# Altium schematic sheet DSP大板子.SchDoc (part 3 of 7)
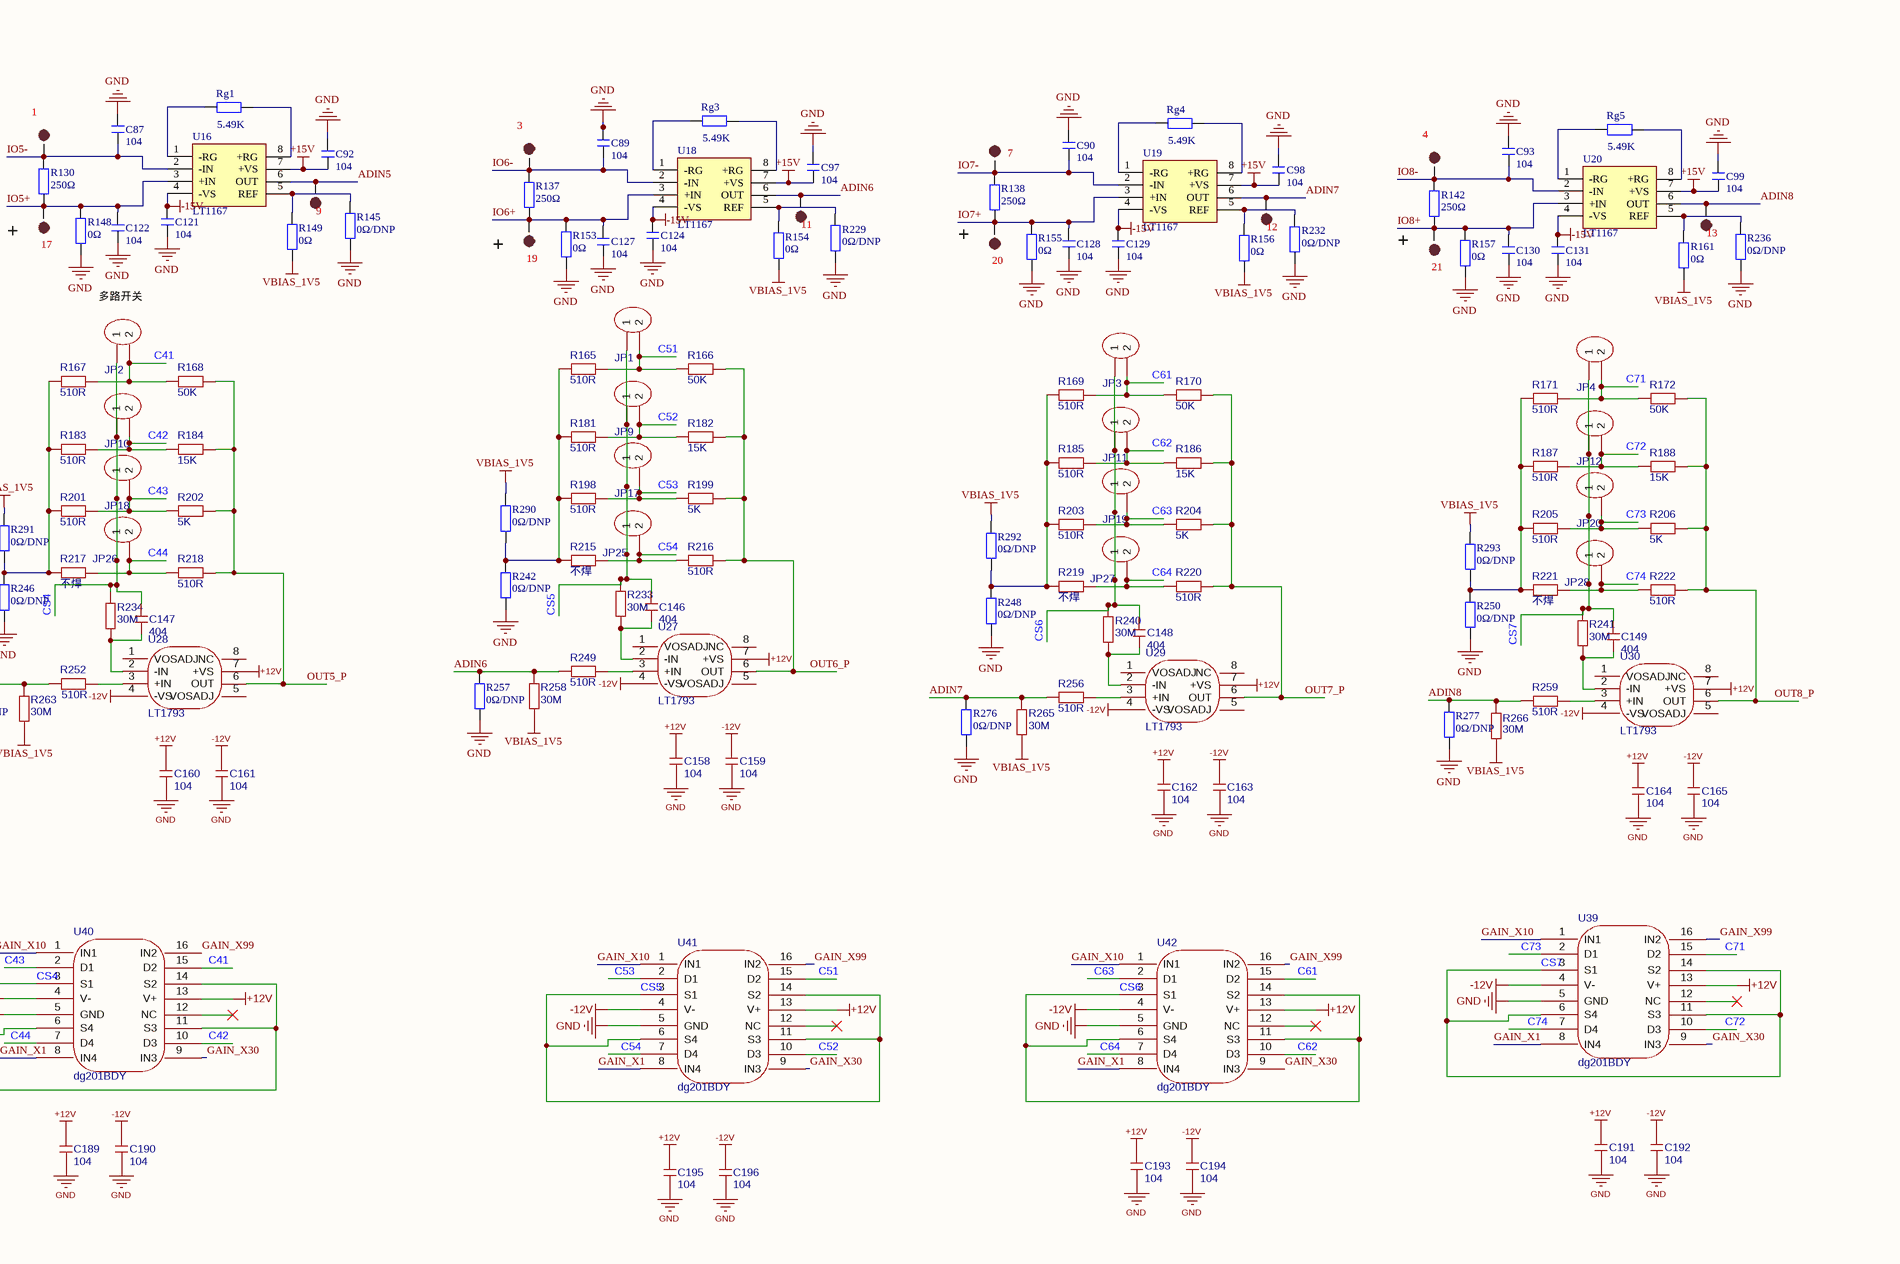
[diagram p106: DSP大板子.SchDoc, bottom right]

# Altium schematic sheet DSP大板子.SchDoc (continued)
D7 = bzt52c12-7-f: 二极管配置:1个独立式;稳压值(标称值):12V;稳压值(范围值):11.4V~12.7V;耗散功率(Pd):370mW;; Manufacturer: DIODES(美台); AddInBom: yes; ModelId: ad7e39f9e5534b3c96ffdc5532ebb493; ModelName: SOD-123_L2.7-W1.6-H1.4-LS3.7; ModelTransform: 146.026,62.992,0,180,0,0,0.0005,0,0; Diode Configuration: 1个独立式; Zener Voltage(Nom): 12V; Reverse Leakage Current (Ir): 100nA@1V; Pd - Power Dissipation: 370mW; Impedance(Zzt): 25Ω; Impedance(Zzk): 150Ω; Operating Junction Temperature Range: -65℃~+150℃; Symbol: BZT52C12-7-F; LCSC Part Name: 独立式 耐压:12V 电流:0.1uA@1.0V; SupplierPart: C124196; ManufacturerPart: BZT52C12-7-F; Supplier Footprint: SOD-123; JLCPCB Part Class: Extended Part; Datasheet: https://item.szlcsc.com/datasheet/BZT52C12-7-F/125471.html; Supplier: LCSC; ConvertToPcb: yes; FootprintName: SOD-123_L2.7-W1.6-LS3.7-RD; Zener Voltage(Range): 11.4V~12.7V; Tolerance: -
F1 = 0451003.mrl: 类型:贴片式保险丝;额定电流:3A;额定电压:125V;分断能力:50A;; Manufacturer: Littelfuse(美国力特); AddInBom: yes; ModelId: ab98867368e34e88a7540bafa62641fb; ModelName: FUSE-SMD_L6.1-W2.7-H2.7; ModelTransform: 240.157,106.299,0,0,0,0,-0.0005,0.0005,0; Type: 贴片式保险丝; Current Rating: 3A; Voltage Rating (DC): 125V; Melting I2t: 0.459; Interrupt Rating: 50A; Symbol: 0451003.MRL; LCSC Part Name: 125V贴片式保险丝; SupplierPart: C13982; ManufacturerPart: 0451003.MRL; Supplier Footprint: 2410; JLCPCB Part Class: Extended Part; Datasheet: https://item.szlcsc.com/datasheet/0451003.MRL/14638.html; Supplier: LCSC; ConvertToPcb: yes; FootprintName: FUSE-SMD_L6.1-W2.7; Operating Temperature: -55℃~+125℃; Diameter (φD): -; Length: 6.1mm; Width: 2.5mm; Height: -; Pitch: -
H1 = a254up-zs05p: 插针结构:2x5P;间距:2.54mm;行距:2.54mm;圆针/方针:方针;安装方式:直插;排数:双排;总PIN位数:10P;额定电流:3A;配合针长度:6mm;塑高:2.5mm;触头材质:铜合金;触头镀层:金;工作温度:-40℃~+105℃;颜色:黑色;; Manufacturer: BXCONN(宝讯); AddInBom: yes; ModelId: c4cfba895466416fb2f10be924625d31; ModelTransform: 500.00294,196.85,0,0,0,0,0,0,-118.11; Pin Structure: 2x5P; Pitch: 2.54mm; Circluar Pins/Square Pins: 方针; Current Rating: 3A; Symbol: A254UP-ZS05P; LCSC Part Name: 2x5P 间距:2.54mm 方针 直插; SupplierPart: C41413842; ManufacturerPart: A254UP-ZS05P; Supplier Footprint: 插件,P=2.54mm; JLCPCB Part Class: Extended Part; Datasheet: https://item.szlcsc.com/datasheet/A254UP-ZS05P/43230049.html; Supplier: LCSC; ConvertToPcb: yes; FootprintName: HDR-TH_10P-P2.54-V-M-R2-C5-S2.54; ModelName: HDR-TH_10P-P2.54-V-M-R2-C5-S2.54; Row Spacing: 2.54mm; Mounting Type: 直插; Number of Rows: 双排; Number of Pins: 10P; Length of Mating Pin: 6mm; Insulation Height: 2.5mm; Contact Material: 铜合金; Contact Plating: 金; Operating Temperature: -40℃~+105℃; Color: 黑色
J2 = Header 12X2: 12*2P接插件; 版权归属: 封装库来自淘宝卖家 ID：黄晶宝石; BOM名称: 12*2P接插件; 学习资源: https://shop463601444.taobao.com
JP1 = Header 2: 2P接插件; 版权归属: 封装库来自淘宝 ID：黄晶宝石; Origin Footprint: XH2.54-WI-2P; OriginFootprint 2: XH2.54-LI-2P; OriginFootprint 3: HDR2.54-M-LI-2P; OriginFootprint 4: HDR2.54-WI-2P; OriginFootprint 5: HDR2.54-WS-2P; OriginFootprint 7: HDR2.54-M-WS-2P; OriginFootprint 8: KF2510-LI-2P; OriginFootprint 9: XH2.54-WS-2P; OriginFootprint 10: XH2.54-LS-2P; OriginFootprint 11: KF2EDGK-2.54-LI-2P; OriginFootprint 12: KF2EDGK-2.54-WI-2P; UniqueId: 307b99641c701ee0; AddInBom: yes; OriginModelName: HDR2.54-1P; Device: Header 2; BOM名称: 2P接插件; 联系售后: https://shop463601444.taobao.com; OriginFootprint 6: HDR2.54-Y-LI-2P; DesignItemID: Header 2; LibraryName: 5.4 - 接插件-脚距2.54 (100mil); SymbolName: Header 2; FootprintName: HDR2.54-LI-2P
JP2 = Header 2: 2P接插件; 版权归属: 封装库来自淘宝 ID：黄晶宝石; Origin Footprint: XH2.54-WI-2P; OriginFootprint 2: XH2.54-LI-2P; OriginFootprint 3: HDR2.54-M-LI-2P; OriginFootprint 4: HDR2.54-WI-2P; OriginFootprint 5: HDR2.54-WS-2P; OriginFootprint 7: HDR2.54-M-WS-2P; OriginFootprint 8: KF2510-LI-2P; OriginFootprint 9: XH2.54-WS-2P; OriginFootprint 10: XH2.54-LS-2P; OriginFootprint 11: KF2EDGK-2.54-LI-2P; OriginFootprint 12: KF2EDGK-2.54-WI-2P; UniqueId: 62dfc6d8d4781687; AddInBom: yes; OriginModelName: HDR2.54-1P; Device: Header 2; BOM名称: 2P接插件; 联系售后: https://shop463601444.taobao.com; OriginFootprint 6: HDR2.54-Y-LI-2P; DesignItemID: Header 2; LibraryName: 5.4 - 接插件-脚距2.54 (100mil); SymbolName: Header 2; FootprintName: HDR2.54-LI-2P
JP3 = Header 2: 2P接插件; 版权归属: 封装库来自淘宝 ID：黄晶宝石; Origin Footprint: XH2.54-WI-2P; OriginFootprint 2: XH2.54-LI-2P; OriginFootprint 3: HDR2.54-M-LI-2P; OriginFootprint 4: HDR2.54-WI-2P; OriginFootprint 5: HDR2.54-WS-2P; OriginFootprint 7: HDR2.54-M-WS-2P; OriginFootprint 8: KF2510-LI-2P; OriginFootprint 9: XH2.54-WS-2P; OriginFootprint 10: XH2.54-LS-2P; OriginFootprint 11: KF2EDGK-2.54-LI-2P; OriginFootprint 12: KF2EDGK-2.54-WI-2P; UniqueId: 7db8ea879d3067b5; AddInBom: yes; OriginModelName: HDR2.54-1P; Device: Header 2; BOM名称: 2P接插件; 联系售后: https://shop463601444.taobao.com; OriginFootprint 6: HDR2.54-Y-LI-2P; DesignItemID: Header 2; LibraryName: 5.4 - 接插件-脚距2.54 (100mil); SymbolName: Header 2; FootprintName: HDR2.54-LI-2P
JP4 = Header 2: 2P接插件; 版权归属: 封装库来自淘宝 ID：黄晶宝石; Origin Footprint: XH2.54-WI-2P; OriginFootprint 2: XH2.54-LI-2P; OriginFootprint 3: HDR2.54-M-LI-2P; OriginFootprint 4: HDR2.54-WI-2P; OriginFootprint 5: HDR2.54-WS-2P; OriginFootprint 7: HDR2.54-M-WS-2P; OriginFootprint 8: KF2510-LI-2P; OriginFootprint 9: XH2.54-WS-2P; OriginFootprint 10: XH2.54-LS-2P; OriginFootprint 11: KF2EDGK-2.54-LI-2P; OriginFootprint 12: KF2EDGK-2.54-WI-2P; UniqueId: fa82831371ccd6d5; AddInBom: yes; OriginModelName: HDR2.54-1P; Device: Header 2; BOM名称: 2P接插件; 联系售后: https://shop463601444.taobao.com; OriginFootprint 6: HDR2.54-Y-LI-2P; DesignItemID: Header 2; LibraryName: 5.4 - 接插件-脚距2.54 (100mil); SymbolName: Header 2; FootprintName: HDR2.54-LI-2P
JP5 = Header 2: 2P接插件; 版权归属: 封装库来自淘宝 ID：黄晶宝石; Origin Footprint: XH2.54-WI-2P; OriginFootprint 2: XH2.54-LI-2P; OriginFootprint 3: HDR2.54-M-LI-2P; OriginFootprint 4: HDR2.54-WI-2P; OriginFootprint 5: HDR2.54-WS-2P; OriginFootprint 7: HDR2.54-M-WS-2P; OriginFootprint 8: KF2510-LI-2P; OriginFootprint 9: XH2.54-WS-2P; OriginFootprint 10: XH2.54-LS-2P; OriginFootprint 11: KF2EDGK-2.54-LI-2P; OriginFootprint 12: KF2EDGK-2.54-WI-2P; UniqueId: 6910556eac3a76a2; AddInBom: yes; OriginModelName: HDR2.54-1P; Device: Header 2; BOM名称: 2P接插件; 联系售后: https://shop463601444.taobao.com; OriginFootprint 6: HDR2.54-Y-LI-2P; DesignItemID: Header 2; LibraryName: 5.4 - 接插件-脚距2.54 (100mil); SymbolName: Header 2; FootprintName: HDR2.54-LI-2P
JP6 = Header 2: 2P接插件; 版权归属: 封装库来自淘宝 ID：黄晶宝石; Origin Footprint: XH2.54-WI-2P; OriginFootprint 2: XH2.54-LI-2P; OriginFootprint 3: HDR2.54-M-LI-2P; OriginFootprint 4: HDR2.54-WI-2P; OriginFootprint 5: HDR2.54-WS-2P; OriginFootprint 7: HDR2.54-M-WS-2P; OriginFootprint 8: KF2510-LI-2P; OriginFootprint 9: XH2.54-WS-2P; OriginFootprint 10: XH2.54-LS-2P; OriginFootprint 11: KF2EDGK-2.54-LI-2P; OriginFootprint 12: KF2EDGK-2.54-WI-2P; UniqueId: 1e4a53fbbd604e66; AddInBom: yes; OriginModelName: HDR2.54-1P; Device: Header 2; BOM名称: 2P接插件; 联系售后: https://shop463601444.taobao.com; OriginFootprint 6: HDR2.54-Y-LI-2P; DesignItemID: Header 2; LibraryName: 5.4 - 接插件-脚距2.54 (100mil); SymbolName: Header 2; FootprintName: HDR2.54-LI-2P
JP7 = Header 2: 2P接插件; 版权归属: 封装库来自淘宝 ID：黄晶宝石; Origin Footprint: XH2.54-WI-2P; OriginFootprint 2: XH2.54-LI-2P; OriginFootprint 3: HDR2.54-M-LI-2P; OriginFootprint 4: HDR2.54-WI-2P; OriginFootprint 5: HDR2.54-WS-2P; OriginFootprint 7: HDR2.54-M-WS-2P; OriginFootprint 8: KF2510-LI-2P; OriginFootprint 9: XH2.54-WS-2P; OriginFootprint 10: XH2.54-LS-2P; OriginFootprint 11: KF2EDGK-2.54-LI-2P; OriginFootprint 12: KF2EDGK-2.54-WI-2P; UniqueId: 6655918135225170; AddInBom: yes; OriginModelName: HDR2.54-1P; Device: Header 2; BOM名称: 2P接插件; 联系售后: https://shop463601444.taobao.com; OriginFootprint 6: HDR2.54-Y-LI-2P; DesignItemID: Header 2; LibraryName: 5.4 - 接插件-脚距2.54 (100mil); SymbolName: Header 2; FootprintName: HDR2.54-LI-2P
JP8 = Header 2: 2P接插件; 版权归属: 封装库来自淘宝 ID：黄晶宝石; Origin Footprint: XH2.54-WI-2P; OriginFootprint 2: XH2.54-LI-2P; OriginFootprint 3: HDR2.54-M-LI-2P; OriginFootprint 4: HDR2.54-WI-2P; OriginFootprint 5: HDR2.54-WS-2P; OriginFootprint 7: HDR2.54-M-WS-2P; OriginFootprint 8: KF2510-LI-2P; OriginFootprint 9: XH2.54-WS-2P; OriginFootprint 10: XH2.54-LS-2P; OriginFootprint 11: KF2EDGK-2.54-LI-2P; OriginFootprint 12: KF2EDGK-2.54-WI-2P; UniqueId: 4577e3d3da87c365; AddInBom: yes; OriginModelName: HDR2.54-1P; Device: Header 2; BOM名称: 2P接插件; 联系售后: https://shop463601444.taobao.com; OriginFootprint 6: HDR2.54-Y-LI-2P; DesignItemID: Header 2; LibraryName: 5.4 - 接插件-脚距2.54 (100mil); SymbolName: Header 2; FootprintName: HDR2.54-LI-2P
JP9 = Header 2: 2P接插件; 版权归属: 封装库来自淘宝 ID：黄晶宝石; Origin Footprint: XH2.54-WI-2P; OriginFootprint 2: XH2.54-LI-2P; OriginFootprint 3: HDR2.54-M-LI-2P; OriginFootprint 4: HDR2.54-WI-2P; OriginFootprint 5: HDR2.54-WS-2P; OriginFootprint 7: HDR2.54-M-WS-2P; OriginFootprint 8: KF2510-LI-2P; OriginFootprint 9: XH2.54-WS-2P; OriginFootprint 10: XH2.54-LS-2P; OriginFootprint 11: KF2EDGK-2.54-LI-2P; OriginFootprint 12: KF2EDGK-2.54-WI-2P; UniqueId: 85e96206a86bca40; AddInBom: yes; OriginModelName: HDR2.54-1P; Device: Header 2; BOM名称: 2P接插件; 联系售后: https://shop463601444.taobao.com; OriginFootprint 6: HDR2.54-Y-LI-2P; DesignItemID: Header 2; LibraryName: 5.4 - 接插件-脚距2.54 (100mil); SymbolName: Header 2; FootprintName: HDR2.54-LI-2P
JP10 = Header 2: 2P接插件; 版权归属: 封装库来自淘宝 ID：黄晶宝石; Origin Footprint: XH2.54-WI-2P; OriginFootprint 2: XH2.54-LI-2P; OriginFootprint 3: HDR2.54-M-LI-2P; OriginFootprint 4: HDR2.54-WI-2P; OriginFootprint 5: HDR2.54-WS-2P; OriginFootprint 7: HDR2.54-M-WS-2P; OriginFootprint 8: KF2510-LI-2P; OriginFootprint 9: XH2.54-WS-2P; OriginFootprint 10: XH2.54-LS-2P; OriginFootprint 11: KF2EDGK-2.54-LI-2P; OriginFootprint 12: KF2EDGK-2.54-WI-2P; UniqueId: ddeec7be49001c93; AddInBom: yes; OriginModelName: HDR2.54-1P; Device: Header 2; BOM名称: 2P接插件; 联系售后: https://shop463601444.taobao.com; OriginFootprint 6: HDR2.54-Y-LI-2P; DesignItemID: Header 2; LibraryName: 5.4 - 接插件-脚距2.54 (100mil); SymbolName: Header 2; FootprintName: HDR2.54-LI-2P
JP11 = Header 2: 2P接插件; 版权归属: 封装库来自淘宝 ID：黄晶宝石; Origin Footprint: XH2.54-WI-2P; OriginFootprint 2: XH2.54-LI-2P; OriginFootprint 3: HDR2.54-M-LI-2P; OriginFootprint 4: HDR2.54-WI-2P; OriginFootprint 5: HDR2.54-WS-2P; OriginFootprint 7: HDR2.54-M-WS-2P; OriginFootprint 8: KF2510-LI-2P; OriginFootprint 9: XH2.54-WS-2P; OriginFootprint 10: XH2.54-LS-2P; OriginFootprint 11: KF2EDGK-2.54-LI-2P; OriginFootprint 12: KF2EDGK-2.54-WI-2P; UniqueId: 6d8656e8ed237838; AddInBom: yes; OriginModelName: HDR2.54-1P; Device: Header 2; BOM名称: 2P接插件; 联系售后: https://shop463601444.taobao.com; OriginFootprint 6: HDR2.54-Y-LI-2P; DesignItemID: Header 2; LibraryName: 5.4 - 接插件-脚距2.54 (100mil); SymbolName: Header 2; FootprintName: HDR2.54-LI-2P
JP12 = Header 2: 2P接插件; 版权归属: 封装库来自淘宝 ID：黄晶宝石; Origin Footprint: XH2.54-WI-2P; OriginFootprint 2: XH2.54-LI-2P; OriginFootprint 3: HDR2.54-M-LI-2P; OriginFootprint 4: HDR2.54-WI-2P; OriginFootprint 5: HDR2.54-WS-2P; OriginFootprint 7: HDR2.54-M-WS-2P; OriginFootprint 8: KF2510-LI-2P; OriginFootprint 9: XH2.54-WS-2P; OriginFootprint 10: XH2.54-LS-2P; OriginFootprint 11: KF2EDGK-2.54-LI-2P; OriginFootprint 12: KF2EDGK-2.54-WI-2P; UniqueId: fcba59359dd8e679; AddInBom: yes; OriginModelName: HDR2.54-1P; Device: Header 2; BOM名称: 2P接插件; 联系售后: https://shop463601444.taobao.com; OriginFootprint 6: HDR2.54-Y-LI-2P; DesignItemID: Header 2; LibraryName: 5.4 - 接插件-脚距2.54 (100mil); SymbolName: Header 2; FootprintName: HDR2.54-LI-2P
JP13 = Header 2: 2P接插件; 版权归属: 封装库来自淘宝 ID：黄晶宝石; Origin Footprint: XH2.54-WI-2P; OriginFootprint 2: XH2.54-LI-2P; OriginFootprint 3: HDR2.54-M-LI-2P; OriginFootprint 4: HDR2.54-WI-2P; OriginFootprint 5: HDR2.54-WS-2P; OriginFootprint 7: HDR2.54-M-WS-2P; OriginFootprint 8: KF2510-LI-2P; OriginFootprint 9: XH2.54-WS-2P; OriginFootprint 10: XH2.54-LS-2P; OriginFootprint 11: KF2EDGK-2.54-LI-2P; OriginFootprint 12: KF2EDGK-2.54-WI-2P; UniqueId: 2c2198ed19c983b6; AddInBom: yes; OriginModelName: HDR2.54-1P; Device: Header 2; BOM名称: 2P接插件; 联系售后: https://shop463601444.taobao.com; OriginFootprint 6: HDR2.54-Y-LI-2P; DesignItemID: Header 2; LibraryName: 5.4 - 接插件-脚距2.54 (100mil); SymbolName: Header 2; FootprintName: HDR2.54-LI-2P
JP14 = Header 2: 2P接插件; 版权归属: 封装库来自淘宝 ID：黄晶宝石; Origin Footprint: XH2.54-WI-2P; OriginFootprint 2: XH2.54-LI-2P; OriginFootprint 3: HDR2.54-M-LI-2P; OriginFootprint 4: HDR2.54-WI-2P; OriginFootprint 5: HDR2.54-WS-2P; OriginFootprint 7: HDR2.54-M-WS-2P; OriginFootprint 8: KF2510-LI-2P; OriginFootprint 9: XH2.54-WS-2P; OriginFootprint 10: XH2.54-LS-2P; OriginFootprint 11: KF2EDGK-2.54-LI-2P; OriginFootprint 12: KF2EDGK-2.54-WI-2P; UniqueId: 2a3f0cfc6900396e; AddInBom: yes; OriginModelName: HDR2.54-1P; Device: Header 2; BOM名称: 2P接插件; 联系售后: https://shop463601444.taobao.com; OriginFootprint 6: HDR2.54-Y-LI-2P; DesignItemID: Header 2; LibraryName: 5.4 - 接插件-脚距2.54 (100mil); SymbolName: Header 2; FootprintName: HDR2.54-LI-2P
JP15 = Header 2: 2P接插件; 版权归属: 封装库来自淘宝 ID：黄晶宝石; Origin Footprint: XH2.54-WI-2P; OriginFootprint 2: XH2.54-LI-2P; OriginFootprint 3: HDR2.54-M-LI-2P; OriginFootprint 4: HDR2.54-WI-2P; OriginFootprint 5: HDR2.54-WS-2P; OriginFootprint 7: HDR2.54-M-WS-2P; OriginFootprint 8: KF2510-LI-2P; OriginFootprint 9: XH2.54-WS-2P; OriginFootprint 10: XH2.54-LS-2P; OriginFootprint 11: KF2EDGK-2.54-LI-2P; OriginFootprint 12: KF2EDGK-2.54-WI-2P; UniqueId: 57b57ccbe062354d; AddInBom: yes; OriginModelName: HDR2.54-1P; Device: Header 2; BOM名称: 2P接插件; 联系售后: https://shop463601444.taobao.com; OriginFootprint 6: HDR2.54-Y-LI-2P; DesignItemID: Header 2; LibraryName: 5.4 - 接插件-脚距2.54 (100mil); SymbolName: Header 2; FootprintName: HDR2.54-LI-2P
JP16 = Header 2: 2P接插件; 版权归属: 封装库来自淘宝 ID：黄晶宝石; Origin Footprint: XH2.54-WI-2P; OriginFootprint 2: XH2.54-LI-2P; OriginFootprint 3: HDR2.54-M-LI-2P; OriginFootprint 4: HDR2.54-WI-2P; OriginFootprint 5: HDR2.54-WS-2P; OriginFootprint 7: HDR2.54-M-WS-2P; OriginFootprint 8: KF2510-LI-2P; OriginFootprint 9: XH2.54-WS-2P; OriginFootprint 10: XH2.54-LS-2P; OriginFootprint 11: KF2EDGK-2.54-LI-2P; OriginFootprint 12: KF2EDGK-2.54-WI-2P; UniqueId: d84cd54a2cd93ea0; AddInBom: yes; OriginModelName: HDR2.54-1P; Device: Header 2; BOM名称: 2P接插件; 联系售后: https://shop463601444.taobao.com; OriginFootprint 6: HDR2.54-Y-LI-2P; DesignItemID: Header 2; LibraryName: 5.4 - 接插件-脚距2.54 (100mil); SymbolName: Header 2; FootprintName: HDR2.54-LI-2P
JP17 = Header 2: 2P接插件; 版权归属: 封装库来自淘宝 ID：黄晶宝石; Origin Footprint: XH2.54-WI-2P; OriginFootprint 2: XH2.54-LI-2P; OriginFootprint 3: HDR2.54-M-LI-2P; OriginFootprint 4: HDR2.54-WI-2P; OriginFootprint 5: HDR2.54-WS-2P; OriginFootprint 7: HDR2.54-M-WS-2P; OriginFootprint 8: KF2510-LI-2P; OriginFootprint 9: XH2.54-WS-2P; OriginFootprint 10: XH2.54-LS-2P; OriginFootprint 11: KF2EDGK-2.54-LI-2P; OriginFootprint 12: KF2EDGK-2.54-WI-2P; UniqueId: c40e93d5b111b9de; AddInBom: yes; OriginModelName: HDR2.54-1P; Device: Header 2; BOM名称: 2P接插件; 联系售后: https://shop463601444.taobao.com; OriginFootprint 6: HDR2.54-Y-LI-2P; DesignItemID: Header 2; LibraryName: 5.4 - 接插件-脚距2.54 (100mil); SymbolName: Header 2; FootprintName: HDR2.54-LI-2P
JP18 = Header 2: 2P接插件; 版权归属: 封装库来自淘宝 ID：黄晶宝石; Origin Footprint: XH2.54-WI-2P; OriginFootprint 2: XH2.54-LI-2P; OriginFootprint 3: HDR2.54-M-LI-2P; OriginFootprint 4: HDR2.54-WI-2P; OriginFootprint 5: HDR2.54-WS-2P; OriginFootprint 7: HDR2.54-M-WS-2P; OriginFootprint 8: KF2510-LI-2P; OriginFootprint 9: XH2.54-WS-2P; OriginFootprint 10: XH2.54-LS-2P; OriginFootprint 11: KF2EDGK-2.54-LI-2P; OriginFootprint 12: KF2EDGK-2.54-WI-2P; UniqueId: dacbd2010d520776; AddInBom: yes; OriginModelName: HDR2.54-1P; Device: Header 2; BOM名称: 2P接插件; 联系售后: https://shop463601444.taobao.com; OriginFootprint 6: HDR2.54-Y-LI-2P; DesignItemID: Header 2; LibraryName: 5.4 - 接插件-脚距2.54 (100mil); SymbolName: Header 2; FootprintName: HDR2.54-LI-2P
JP19 = Header 2: 2P接插件; 版权归属: 封装库来自淘宝 ID：黄晶宝石; Origin Footprint: XH2.54-WI-2P; OriginFootprint 2: XH2.54-LI-2P; OriginFootprint 3: HDR2.54-M-LI-2P; OriginFootprint 4: HDR2.54-WI-2P; OriginFootprint 5: HDR2.54-WS-2P; OriginFootprint 7: HDR2.54-M-WS-2P; OriginFootprint 8: KF2510-LI-2P; OriginFootprint 9: XH2.54-WS-2P; OriginFootprint 10: XH2.54-LS-2P; OriginFootprint 11: KF2EDGK-2.54-LI-2P; OriginFootprint 12: KF2EDGK-2.54-WI-2P; UniqueId: 61cd62acef56a4b1; AddInBom: yes; OriginModelName: HDR2.54-1P; Device: Header 2; BOM名称: 2P接插件; 联系售后: https://shop463601444.taobao.com; OriginFootprint 6: HDR2.54-Y-LI-2P; DesignItemID: Header 2; LibraryName: 5.4 - 接插件-脚距2.54 (100mil); SymbolName: Header 2; FootprintName: HDR2.54-LI-2P
JP20 = Header 2: 2P接插件; 版权归属: 封装库来自淘宝 ID：黄晶宝石; Origin Footprint: XH2.54-WI-2P; OriginFootprint 2: XH2.54-LI-2P; OriginFootprint 3: HDR2.54-M-LI-2P; OriginFootprint 4: HDR2.54-WI-2P; OriginFootprint 5: HDR2.54-WS-2P; OriginFootprint 7: HDR2.54-M-WS-2P; OriginFootprint 8: KF2510-LI-2P; OriginFootprint 9: XH2.54-WS-2P; OriginFootprint 10: XH2.54-LS-2P; OriginFootprint 11: KF2EDGK-2.54-LI-2P; OriginFootprint 12: KF2EDGK-2.54-WI-2P; UniqueId: 228f0eb2e9fc8410; AddInBom: yes; OriginModelName: HDR2.54-1P; Device: Header 2; BOM名称: 2P接插件; 联系售后: https://shop463601444.taobao.com; OriginFootprint 6: HDR2.54-Y-LI-2P; DesignItemID: Header 2; LibraryName: 5.4 - 接插件-脚距2.54 (100mil); SymbolName: Header 2; FootprintName: HDR2.54-LI-2P
JP21 = Header 2: 2P接插件; 版权归属: 封装库来自淘宝 ID：黄晶宝石; Origin Footprint: XH2.54-WI-2P; OriginFootprint 2: XH2.54-LI-2P; OriginFootprint 3: HDR2.54-M-LI-2P; OriginFootprint 4: HDR2.54-WI-2P; OriginFootprint 5: HDR2.54-WS-2P; OriginFootprint 7: HDR2.54-M-WS-2P; OriginFootprint 8: KF2510-LI-2P; OriginFootprint 9: XH2.54-WS-2P; OriginFootprint 10: XH2.54-LS-2P; OriginFootprint 11: KF2EDGK-2.54-LI-2P; OriginFootprint 12: KF2EDGK-2.54-WI-2P; UniqueId: 8401f236ce86758e; AddInBom: yes; OriginModelName: HDR2.54-1P; Device: Header 2; BOM名称: 2P接插件; 联系售后: https://shop463601444.taobao.com; OriginFootprint 6: HDR2.54-Y-LI-2P; DesignItemID: Header 2; LibraryName: 5.4 - 接插件-脚距2.54 (100mil); SymbolName: Header 2; FootprintName: HDR2.54-LI-2P
JP22 = Header 2: 2P接插件; 版权归属: 封装库来自淘宝 ID：黄晶宝石; Origin Footprint: XH2.54-WI-2P; OriginFootprint 2: XH2.54-LI-2P; OriginFootprint 3: HDR2.54-M-LI-2P; OriginFootprint 4: HDR2.54-WI-2P; OriginFootprint 5: HDR2.54-WS-2P; OriginFootprint 7: HDR2.54-M-WS-2P; OriginFootprint 8: KF2510-LI-2P; OriginFootprint 9: XH2.54-WS-2P; OriginFootprint 10: XH2.54-LS-2P; OriginFootprint 11: KF2EDGK-2.54-LI-2P; OriginFootprint 12: KF2EDGK-2.54-WI-2P; UniqueId: 81515d3ba89c45d7; AddInBom: yes; OriginModelName: HDR2.54-1P; Device: Header 2; BOM名称: 2P接插件; 联系售后: https://shop463601444.taobao.com; OriginFootprint 6: HDR2.54-Y-LI-2P; DesignItemID: Header 2; LibraryName: 5.4 - 接插件-脚距2.54 (100mil); SymbolName: Header 2; FootprintName: HDR2.54-LI-2P
JP23 = Header 2: 2P接插件; 版权归属: 封装库来自淘宝 ID：黄晶宝石; Origin Footprint: XH2.54-WI-2P; OriginFootprint 2: XH2.54-LI-2P; OriginFootprint 3: HDR2.54-M-LI-2P; OriginFootprint 4: HDR2.54-WI-2P; OriginFootprint 5: HDR2.54-WS-2P; OriginFootprint 7: HDR2.54-M-WS-2P; OriginFootprint 8: KF2510-LI-2P; OriginFootprint 9: XH2.54-WS-2P; OriginFootprint 10: XH2.54-LS-2P; OriginFootprint 11: KF2EDGK-2.54-LI-2P; OriginFootprint 12: KF2EDGK-2.54-WI-2P; UniqueId: 0a06460673946c5c; AddInBom: yes; OriginModelName: HDR2.54-1P; Device: Header 2; BOM名称: 2P接插件; 联系售后: https://shop463601444.taobao.com; OriginFootprint 6: HDR2.54-Y-LI-2P; DesignItemID: Header 2; LibraryName: 5.4 - 接插件-脚距2.54 (100mil); SymbolName: Header 2; FootprintName: HDR2.54-LI-2P
JP24 = Header 2: 2P接插件; 版权归属: 封装库来自淘宝 ID：黄晶宝石; Origin Footprint: XH2.54-WI-2P; OriginFootprint 2: XH2.54-LI-2P; OriginFootprint 3: HDR2.54-M-LI-2P; OriginFootprint 4: HDR2.54-WI-2P; OriginFootprint 5: HDR2.54-WS-2P; OriginFootprint 7: HDR2.54-M-WS-2P; OriginFootprint 8: KF2510-LI-2P; OriginFootprint 9: XH2.54-WS-2P; OriginFootprint 10: XH2.54-LS-2P; OriginFootprint 11: KF2EDGK-2.54-LI-2P; OriginFootprint 12: KF2EDGK-2.54-WI-2P; UniqueId: 7ff5f6d6ea161ff3; AddInBom: yes; OriginModelName: HDR2.54-1P; Device: Header 2; BOM名称: 2P接插件; 联系售后: https://shop463601444.taobao.com; OriginFootprint 6: HDR2.54-Y-LI-2P; DesignItemID: Header 2; LibraryName: 5.4 - 接插件-脚距2.54 (100mil); SymbolName: Header 2; FootprintName: HDR2.54-LI-2P
JP25 = Header 2: 2P接插件; 版权归属: 封装库来自淘宝 ID：黄晶宝石; Origin Footprint: XH2.54-WI-2P; OriginFootprint 2: XH2.54-LI-2P; OriginFootprint 3: HDR2.54-M-LI-2P; OriginFootprint 4: HDR2.54-WI-2P; OriginFootprint 5: HDR2.54-WS-2P; OriginFootprint 7: HDR2.54-M-WS-2P; OriginFootprint 8: KF2510-LI-2P; OriginFootprint 9: XH2.54-WS-2P; OriginFootprint 10: XH2.54-LS-2P; OriginFootprint 11: KF2EDGK-2.54-LI-2P; OriginFootprint 12: KF2EDGK-2.54-WI-2P; UniqueId: ac1a4a7fdd8dee85; AddInBom: yes; OriginModelName: HDR2.54-1P; Device: Header 2; BOM名称: 2P接插件; 联系售后: https://shop463601444.taobao.com; OriginFootprint 6: HDR2.54-Y-LI-2P; DesignItemID: Header 2; LibraryName: 5.4 - 接插件-脚距2.54 (100mil); SymbolName: Header 2; FootprintName: HDR2.54-LI-2P
JP26 = Header 2: 2P接插件; 版权归属: 封装库来自淘宝 ID：黄晶宝石; Origin Footprint: XH2.54-WI-2P; OriginFootprint 2: XH2.54-LI-2P; OriginFootprint 3: HDR2.54-M-LI-2P; OriginFootprint 4: HDR2.54-WI-2P; OriginFootprint 5: HDR2.54-WS-2P; OriginFootprint 7: HDR2.54-M-WS-2P; OriginFootprint 8: KF2510-LI-2P; OriginFootprint 9: XH2.54-WS-2P; OriginFootprint 10: XH2.54-LS-2P; OriginFootprint 11: KF2EDGK-2.54-LI-2P; OriginFootprint 12: KF2EDGK-2.54-WI-2P; UniqueId: 02277a1cd8d596a2; AddInBom: yes; OriginModelName: HDR2.54-1P; Device: Header 2; BOM名称: 2P接插件; 联系售后: https://shop463601444.taobao.com; OriginFootprint 6: HDR2.54-Y-LI-2P; DesignItemID: Header 2; LibraryName: 5.4 - 接插件-脚距2.54 (100mil); SymbolName: Header 2; FootprintName: HDR2.54-LI-2P
JP27 = Header 2: 2P接插件; 版权归属: 封装库来自淘宝 ID：黄晶宝石; Origin Footprint: XH2.54-WI-2P; OriginFootprint 2: XH2.54-LI-2P; OriginFootprint 3: HDR2.54-M-LI-2P; OriginFootprint 4: HDR2.54-WI-2P; OriginFootprint 5: HDR2.54-WS-2P; OriginFootprint 7: HDR2.54-M-WS-2P; OriginFootprint 8: KF2510-LI-2P; OriginFootprint 9: XH2.54-WS-2P; OriginFootprint 10: XH2.54-LS-2P; OriginFootprint 11: KF2EDGK-2.54-LI-2P; OriginFootprint 12: KF2EDGK-2.54-WI-2P; UniqueId: 0f3af21d7fc89682; AddInBom: yes; OriginModelName: HDR2.54-1P; Device: Header 2; BOM名称: 2P接插件; 联系售后: https://shop463601444.taobao.com; OriginFootprint 6: HDR2.54-Y-LI-2P; DesignItemID: Header 2; LibraryName: 5.4 - 接插件-脚距2.54 (100mil); SymbolName: Header 2; FootprintName: HDR2.54-LI-2P
JP28 = Header 2: 2P接插件; 版权归属: 封装库来自淘宝 ID：黄晶宝石; Origin Footprint: XH2.54-WI-2P; OriginFootprint 2: XH2.54-LI-2P; OriginFootprint 3: HDR2.54-M-LI-2P; OriginFootprint 4: HDR2.54-WI-2P; OriginFootprint 5: HDR2.54-WS-2P; OriginFootprint 7: HDR2.54-M-WS-2P; OriginFootprint 8: KF2510-LI-2P; OriginFootprint 9: XH2.54-WS-2P; OriginFootprint 10: XH2.54-LS-2P; OriginFootprint 11: KF2EDGK-2.54-LI-2P; OriginFootprint 12: KF2EDGK-2.54-WI-2P; UniqueId: 935b54861c2e40de; AddInBom: yes; OriginModelName: HDR2.54-1P; Device: Header 2; BOM名称: 2P接插件; 联系售后: https://shop463601444.taobao.com; OriginFootprint 6: HDR2.54-Y-LI-2P; DesignItemID: Header 2; LibraryName: 5.4 - 接插件-脚距2.54 (100mil); SymbolName: Header 2; FootprintName: HDR2.54-LI-2P